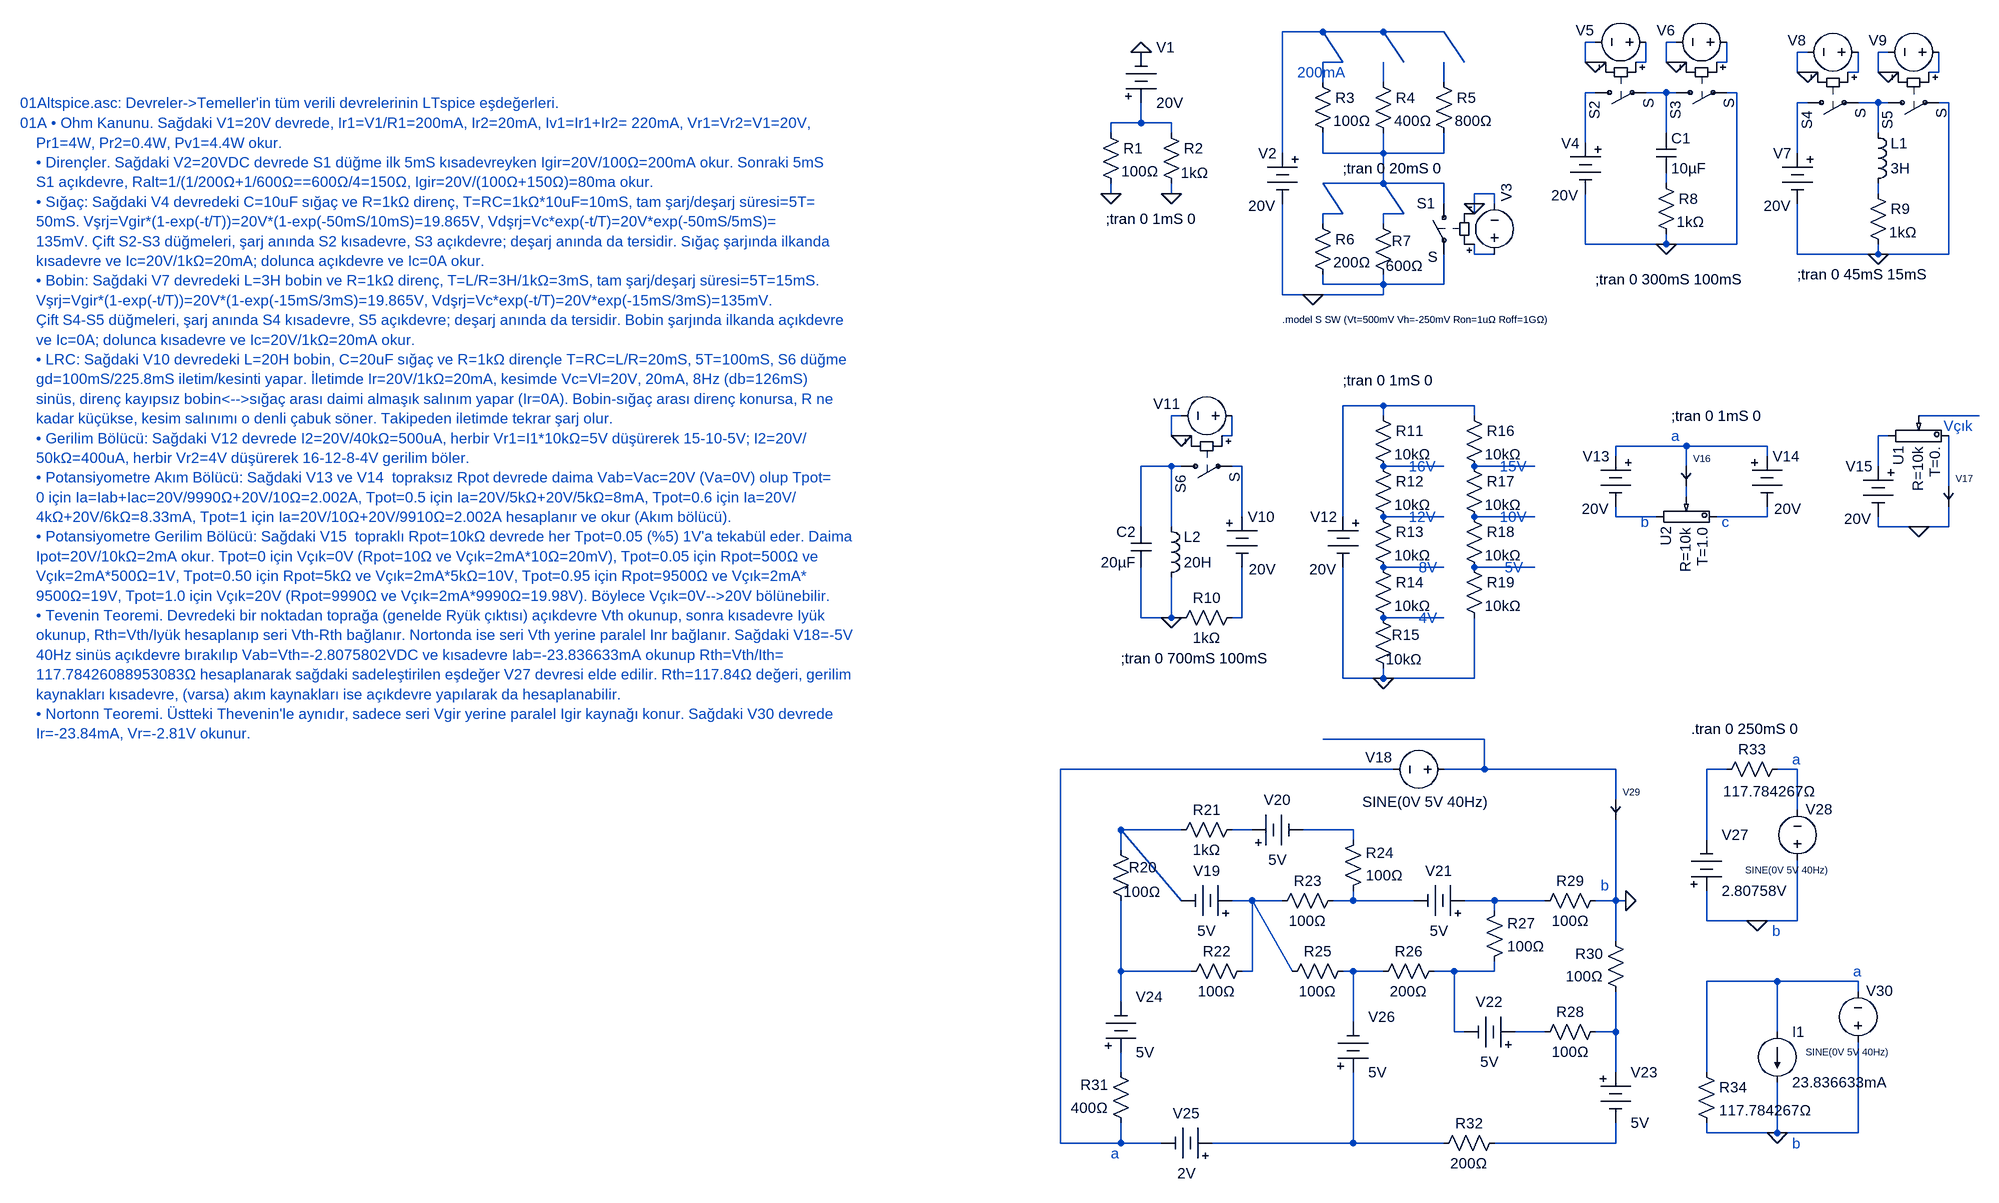
[diagram p0: schematic 01Altspice.asc]
01Altspice.asc, the LTspice schematic file:
Version 4
SHEET 1 2528 1760
WIRE 1280 -64 1216 -64
WIRE 1376 -64 1280 -64
WIRE 1472 -64 1376 -64
WIRE 1712 -48 1696 -48
WIRE 1840 -48 1824 -48
WIRE 2048 -32 2032 -32
WIRE 2176 -32 2160 -32
WIRE 1312 -16 1280 -64
WIRE 1312 -16 1280 -16
WIRE 1408 -16 1376 -64
WIRE 1504 -16 1472 -64
WIRE 1696 -16 1696 -48
WIRE 1712 -16 1696 -16
WIRE 1728 -16 1712 -16
WIRE 1792 -16 1792 -48
WIRE 1792 -16 1776 -16
WIRE 1824 -16 1824 -48
WIRE 1840 -16 1824 -16
WIRE 1856 -16 1840 -16
WIRE 1920 -16 1920 -48
WIRE 1920 -16 1904 -16
WIRE 2032 0 2032 -32
WIRE 2048 0 2032 0
WIRE 2064 0 2048 0
WIRE 2128 0 2128 -32
WIRE 2128 0 2112 0
WIRE 2160 0 2160 -32
WIRE 2176 0 2160 0
WIRE 2192 0 2176 0
WIRE 2256 0 2256 -32
WIRE 2256 0 2240 0
WIRE 1280 16 1280 -16
WIRE 1376 16 1376 -16
WIRE 1472 16 1472 -16
WIRE 1712 32 1696 32
WIRE 1824 32 1792 32
WIRE 1840 32 1824 32
WIRE 1936 32 1920 32
WIRE 2048 48 2032 48
WIRE 2160 48 2128 48
WIRE 2176 48 2160 48
WIRE 2272 48 2256 48
WIRE 992 80 992 48
WIRE 992 80 944 80
WIRE 1040 80 992 80
WIRE 944 96 944 80
WIRE 1040 96 1040 80
WIRE 1824 96 1824 32
WIRE 2160 96 2160 48
WIRE 1696 112 1696 32
WIRE 1216 128 1216 -64
WIRE 1280 128 1280 96
WIRE 1376 128 1376 96
WIRE 1376 128 1280 128
WIRE 1472 128 1472 96
WIRE 1472 128 1376 128
WIRE 2032 128 2032 48
WIRE 1376 176 1376 128
WIRE 1376 176 1280 176
WIRE 1472 176 1376 176
WIRE 1824 176 1824 160
WIRE 944 192 944 176
WIRE 1040 192 1040 176
WIRE 1552 192 1520 192
WIRE 2160 192 2160 176
WIRE 1472 208 1472 176
WIRE 1520 208 1520 192
WIRE 1552 208 1552 192
WIRE 1312 224 1280 176
WIRE 1312 224 1280 224
WIRE 1408 224 1376 176
WIRE 1408 224 1376 224
WIRE 1520 224 1520 208
WIRE 1280 240 1280 224
WIRE 1376 240 1376 224
WIRE 1696 272 1696 192
WIRE 1824 272 1824 256
WIRE 1824 272 1696 272
WIRE 1936 272 1936 32
WIRE 1936 272 1824 272
WIRE 1520 288 1520 272
WIRE 1552 288 1520 288
WIRE 2032 288 2032 208
WIRE 2160 288 2160 272
WIRE 2160 288 2032 288
WIRE 2272 288 2272 48
WIRE 2272 288 2160 288
WIRE 1280 336 1280 320
WIRE 1376 336 1376 320
WIRE 1376 336 1280 336
WIRE 1472 336 1472 288
WIRE 1472 336 1376 336
WIRE 1216 352 1216 208
WIRE 1264 352 1216 352
WIRE 1376 352 1376 336
WIRE 1376 352 1264 352
WIRE 1376 528 1312 528
WIRE 1520 528 1376 528
WIRE 1056 544 1040 544
WIRE 1376 544 1376 528
WIRE 1520 544 1520 528
WIRE 2320 544 2224 544
WIRE 1040 576 1040 544
WIRE 1056 576 1040 576
WIRE 1072 576 1056 576
WIRE 1136 576 1136 544
WIRE 1136 576 1120 576
WIRE 2176 576 2160 576
WIRE 1856 592 1744 592
WIRE 1984 592 1856 592
WIRE 1744 608 1744 592
WIRE 1984 608 1984 592
WIRE 1040 624 992 624
WIRE 1056 624 1040 624
WIRE 1152 624 1136 624
WIRE 1472 624 1376 624
WIRE 1616 624 1520 624
WIRE 1856 624 1856 592
WIRE 2160 624 2160 576
WIRE 2272 656 2272 576
WIRE 1856 672 1856 656
WIRE 1152 704 1152 624
WIRE 1312 704 1312 528
WIRE 1472 704 1376 704
WIRE 1616 704 1520 704
WIRE 1744 704 1744 688
WIRE 1808 704 1744 704
WIRE 1984 704 1984 688
WIRE 1984 704 1904 704
WIRE 992 720 992 624
WIRE 1040 720 1040 624
WIRE 2160 720 2160 704
WIRE 2224 720 2160 720
WIRE 2272 720 2272 688
WIRE 2272 720 2224 720
WIRE 1472 784 1376 784
WIRE 1616 784 1520 784
WIRE 992 864 992 784
WIRE 1040 864 1040 800
WIRE 1040 864 992 864
WIRE 1056 864 1040 864
WIRE 1152 864 1152 784
WIRE 1152 864 1136 864
WIRE 1472 864 1376 864
WIRE 1312 960 1312 784
WIRE 1376 960 1376 944
WIRE 1376 960 1312 960
WIRE 1520 960 1520 864
WIRE 1520 960 1376 960
WIRE 1536 1056 1280 1056
WIRE 1392 1104 864 1104
WIRE 1536 1104 1536 1056
WIRE 1536 1104 1472 1104
WIRE 1744 1104 1536 1104
WIRE 1920 1104 1888 1104
WIRE 2032 1104 2000 1104
WIRE 1744 1152 1744 1104
WIRE 2032 1168 2032 1104
WIRE 1056 1200 960 1200
WIRE 1168 1200 1136 1200
WIRE 1328 1200 1248 1200
WIRE 1328 1216 1328 1200
WIRE 1888 1216 1888 1104
WIRE 960 1232 960 1200
WIRE 1056 1312 960 1200
WIRE 1168 1312 1136 1312
WIRE 1216 1312 1168 1312
WIRE 1328 1312 1328 1296
WIRE 1328 1312 1296 1312
WIRE 1424 1312 1328 1312
WIRE 1552 1312 1504 1312
WIRE 1632 1312 1552 1312
WIRE 1744 1312 1744 1184
WIRE 1744 1312 1712 1312
WIRE 1760 1312 1744 1312
WIRE 1552 1328 1552 1312
WIRE 1888 1344 1888 1296
WIRE 1968 1344 1888 1344
WIRE 2032 1344 2032 1248
WIRE 2032 1344 1968 1344
WIRE 1744 1376 1744 1312
WIRE 960 1424 960 1312
WIRE 1072 1424 960 1424
WIRE 1168 1424 1168 1312
WIRE 1168 1424 1152 1424
WIRE 1232 1424 1168 1312
WIRE 1328 1424 1312 1424
WIRE 1376 1424 1328 1424
WIRE 1488 1424 1456 1424
WIRE 1552 1424 1552 1408
WIRE 1552 1424 1488 1424
WIRE 2000 1440 1888 1440
WIRE 2128 1440 2000 1440
WIRE 2128 1456 2128 1440
WIRE 960 1472 960 1424
WIRE 1328 1504 1328 1424
WIRE 1488 1520 1488 1424
WIRE 1504 1520 1488 1520
WIRE 1632 1520 1584 1520
WIRE 1744 1520 1744 1456
WIRE 1744 1520 1712 1520
WIRE 2000 1520 2000 1440
WIRE 960 1584 960 1552
WIRE 1744 1584 1744 1520
WIRE 1888 1584 1888 1440
WIRE 1888 1680 1888 1664
WIRE 2000 1680 2000 1600
WIRE 2000 1680 1888 1680
WIRE 2128 1680 2128 1536
WIRE 2128 1680 2000 1680
WIRE 864 1696 864 1104
WIRE 960 1696 960 1664
WIRE 960 1696 864 1696
WIRE 1024 1696 960 1696
WIRE 1328 1696 1328 1584
WIRE 1328 1696 1104 1696
WIRE 1472 1696 1328 1696
WIRE 1744 1696 1744 1664
WIRE 1744 1696 1552 1696
FLAG 944 192 0
FLAG 1040 192 0
FLAG 992 -32 0
FLAG 1264 352 0
FLAG 1520 208 0
FLAG 1712 -16 0
FLAG 1824 272 0
FLAG 1840 -16 0
FLAG 2048 0 0
FLAG 2160 288 0
FLAG 2176 0 0
FLAG 1040 864 0
FLAG 1056 576 0
FLAG 1376 960 0
FLAG 2224 720 0
FLAG 1760 1312 0
FLAG 1968 1344 0
FLAG 2000 1680 0
SYMBOL Misc\\battery 992 64 M180
WINDOW 0 24 104 Left 2
WINDOW 3 24 16 Left 2
SYMATTR InstName V1
SYMATTR Value 20V
SYMBOL res 928 80 R0
WINDOW 3 33 77 Left 2
SYMATTR Value 100Ω
SYMATTR InstName R1
SYMBOL res 1024 80 R0
WINDOW 3 31 79 Left 2
SYMATTR Value 1kΩ
SYMATTR InstName R2
SYMBOL Misc\\battery 1216 112 M0
WINDOW 0 9 16 Left 2
WINDOW 3 11 99 Left 2
SYMATTR InstName V2
SYMATTR Value 20V
SYMBOL res 1264 0 R0
WINDOW 3 33 77 Left 2
SYMATTR Value 100Ω
SYMATTR InstName R3
SYMBOL res 1360 0 R0
WINDOW 3 33 77 Left 2
SYMATTR Value 400Ω
SYMATTR InstName R4
SYMBOL res 1456 0 R0
WINDOW 3 33 77 Left 2
SYMATTR Value 800Ω
SYMATTR InstName R5
SYMBOL res 1264 224 R0
WINDOW 3 33 77 Left 2
SYMATTR Value 200Ω
SYMATTR InstName R6
SYMBOL res 1360 224 R0
WINDOW 3 20 82 Left 2
WINDOW 0 29 43 Left 2
SYMATTR Value 600Ω
SYMATTR InstName R7
SYMBOL sw 1472 192 M0
WINDOW 0 14 15 Left 2
WINDOW 3 10 100 Left 2
SYMATTR InstName S1
SYMATTR Value S
SYMBOL voltage 1552 304 M180
WINDOW 0 19 98 VRight 2
WINDOW 3 67 -33 Invisible 2
WINDOW 123 0 0 Left 0
WINDOW 39 0 0 Left 0
SYMATTR InstName V3
SYMATTR Value PULSE(0V 1V 0S 1nS 1nS 5mS 10mS)
SYMBOL Misc\\battery 1696 96 M0
WINDOW 0 9 16 Left 2
WINDOW 3 11 99 Left 2
SYMATTR InstName V4
SYMATTR Value 20V
SYMBOL cap 1808 96 R0
SYMATTR InstName C1
SYMATTR Value 10µF
SYMBOL res 1808 160 R0
WINDOW 3 33 77 Left 2
SYMATTR Value 1kΩ
SYMATTR InstName R8
SYMBOL sw 1696 32 M90
WINDOW 0 14 15 Left 2
WINDOW 3 10 100 Left 2
SYMATTR InstName S2
SYMATTR Value S
SYMBOL voltage 1808 -48 M270
WINDOW 0 19 98 VRight 2
WINDOW 3 67 -33 Invisible 2
WINDOW 123 0 0 Left 0
WINDOW 39 0 0 Left 0
SYMATTR InstName V5
SYMATTR Value PULSE(0V 1V 0S 1nS 1nS 50mS 100mS)
SYMBOL sw 1824 32 M90
WINDOW 0 14 15 Left 2
WINDOW 3 10 100 Left 2
SYMATTR InstName S3
SYMATTR Value S
SYMBOL voltage 1936 -48 M270
WINDOW 0 19 98 VRight 2
WINDOW 3 67 -33 Invisible 2
WINDOW 123 0 0 Left 0
WINDOW 39 0 0 Left 0
SYMATTR InstName V6
SYMATTR Value PULSE(0V 1V 50mS 1nS 1nS 50mS 100mS)
SYMBOL Misc\\battery 2032 112 M0
WINDOW 0 9 16 Left 2
WINDOW 3 11 99 Left 2
SYMATTR InstName V7
SYMATTR Value 20V
SYMBOL res 2144 176 R0
WINDOW 3 33 77 Left 2
SYMATTR Value 1kΩ
SYMATTR InstName R9
SYMBOL sw 2032 48 M90
WINDOW 0 14 15 Left 2
WINDOW 3 10 100 Left 2
SYMATTR InstName S4
SYMATTR Value S
SYMBOL voltage 2144 -32 M270
WINDOW 0 19 98 VRight 2
WINDOW 3 67 -33 Invisible 2
WINDOW 123 0 0 Left 0
WINDOW 39 0 0 Left 0
SYMATTR InstName V8
SYMATTR Value PULSE(0V 1V 0S 1nS 1nS 15mS 30mS)
SYMBOL sw 2160 48 M90
WINDOW 0 14 15 Left 2
WINDOW 3 10 100 Left 2
SYMATTR InstName S5
SYMATTR Value S
SYMBOL voltage 2272 -32 M270
WINDOW 0 19 98 VRight 2
WINDOW 3 67 -33 Invisible 2
WINDOW 123 0 0 Left 0
WINDOW 39 0 0 Left 0
SYMATTR InstName V9
SYMATTR Value PULSE(0V 1V 15mS 1nS 1nS 15mS 30mS)
SYMBOL ind 2144 192 M180
WINDOW 0 36 80 Left 2
WINDOW 3 36 40 Left 2
SYMATTR InstName L1
SYMATTR Value 3H
SYMBOL Misc\\battery 1152 688 R0
WINDOW 0 9 16 Left 2
WINDOW 3 11 99 Left 2
SYMATTR InstName V10
SYMATTR Value 20V
SYMBOL res 1152 848 R90
WINDOW 3 32 56 VTop 2
WINDOW 0 0 56 VBottom 2
SYMATTR Value 1kΩ
SYMATTR InstName R10
SYMBOL sw 1040 624 M90
WINDOW 0 14 15 Left 2
WINDOW 3 10 100 Left 2
SYMATTR InstName S6
SYMATTR Value S
SYMBOL voltage 1152 544 M270
WINDOW 0 19 98 VRight 2
WINDOW 3 67 -33 Invisible 2
WINDOW 123 0 0 Left 0
WINDOW 39 0 0 Left 0
SYMATTR InstName V11
SYMATTR Value PULSE(0V 1V 0mS 1nS 1nS 100mS 225.8mS)
SYMBOL ind 1024 816 M180
WINDOW 0 36 80 Left 2
WINDOW 3 36 40 Left 2
SYMATTR InstName L2
SYMATTR Value 20H
SYMBOL cap 1008 720 M0
SYMATTR InstName C2
SYMATTR Value 20µF
SYMBOL Misc\\battery 1312 688 M0
WINDOW 0 9 16 Left 2
WINDOW 3 11 99 Left 2
SYMATTR InstName V12
SYMATTR Value 20V
SYMBOL res 1360 528 R0
WINDOW 3 33 77 Left 2
SYMATTR Value 10kΩ
SYMATTR InstName R11
SYMBOL res 1360 608 R0
WINDOW 3 33 77 Left 2
SYMATTR Value 10kΩ
SYMATTR InstName R12
SYMBOL res 1360 688 R0
WINDOW 3 33 77 Left 2
SYMATTR Value 10kΩ
SYMATTR InstName R13
SYMBOL res 1360 768 R0
WINDOW 3 33 77 Left 2
SYMATTR Value 10kΩ
SYMATTR InstName R14
SYMBOL res 1360 848 R0
WINDOW 3 20 82 Left 2
WINDOW 0 29 43 Left 2
SYMATTR Value 10kΩ
SYMATTR InstName R15
SYMBOL res 1504 528 R0
WINDOW 3 33 77 Left 2
SYMATTR Value 10kΩ
SYMATTR InstName R16
SYMBOL res 1504 608 R0
WINDOW 3 33 77 Left 2
SYMATTR Value 10kΩ
SYMATTR InstName R17
SYMBOL res 1504 688 R0
WINDOW 3 33 77 Left 2
SYMATTR Value 10kΩ
SYMATTR InstName R18
SYMBOL res 1504 768 R0
WINDOW 3 33 77 Left 2
SYMATTR Value 10kΩ
SYMATTR InstName R19
SYMBOL Misc\\battery 2160 608 M0
WINDOW 0 9 16 Left 2
WINDOW 3 11 99 Left 2
SYMATTR InstName V15
SYMATTR Value 20V
SYMBOL pot 2224 576 M90
SYMATTR InstName U1
SYMATTR Value2 T=0.
SYMBOL Misc\\battery 1744 592 M0
WINDOW 0 9 16 Left 2
WINDOW 3 11 99 Left 2
SYMATTR InstName V13
SYMATTR Value 20V
SYMBOL Misc\\battery 1984 592 R0
WINDOW 0 9 16 Left 2
WINDOW 3 11 99 Left 2
SYMATTR InstName V14
SYMATTR Value 20V
SYMBOL pot 1856 704 M90
SYMATTR InstName U2
SYMATTR Value2 T=1.0
SYMBOL Ammeter 1856 608 R0
SYMATTR InstName V16
SYMBOL Ammeter 2272 640 R0
SYMATTR InstName V17
SYMBOL res 944 1216 R0
WINDOW 3 20 82 Left 2
WINDOW 0 29 43 Left 2
SYMATTR Value 100Ω
SYMATTR InstName R20
SYMBOL res 1152 1184 R90
WINDOW 3 32 56 VTop 2
WINDOW 0 0 56 VBottom 2
SYMATTR Value 1kΩ
SYMATTR InstName R21
SYMBOL Misc\\battery 1152 1312 M270
WINDOW 0 32 56 VTop 2
WINDOW 3 -32 56 VBottom 2
SYMATTR InstName V19
SYMATTR Value 5V
SYMBOL res 1168 1408 R90
WINDOW 3 32 56 VTop 2
WINDOW 0 0 56 VBottom 2
SYMATTR Value 100Ω
SYMATTR InstName R22
SYMBOL Misc\\battery 1152 1200 R270
WINDOW 0 32 56 VTop 2
WINDOW 3 -32 56 VBottom 2
SYMATTR InstName V20
SYMATTR Value 5V
SYMBOL res 1312 1296 R90
WINDOW 3 32 56 VTop 2
WINDOW 0 0 56 VBottom 2
SYMATTR Value 100Ω
SYMATTR InstName R23
SYMBOL res 1312 1312 M180
WINDOW 3 36 40 Left 2
WINDOW 0 36 76 Left 2
SYMATTR Value 100Ω
SYMATTR InstName R24
SYMBOL Misc\\battery 1520 1312 M270
WINDOW 0 32 56 VTop 2
WINDOW 3 -32 56 VBottom 2
SYMATTR InstName V21
SYMATTR Value 5V
SYMBOL res 1328 1408 R90
WINDOW 3 32 56 VTop 2
WINDOW 0 0 56 VBottom 2
SYMATTR Value 100Ω
SYMATTR InstName R25
SYMBOL res 1472 1408 R90
WINDOW 3 32 56 VTop 2
WINDOW 0 0 56 VBottom 2
SYMATTR Value 200Ω
SYMATTR InstName R26
SYMBOL res 1536 1424 M180
WINDOW 3 36 40 Left 2
WINDOW 0 36 76 Left 2
SYMATTR Value 100Ω
SYMATTR InstName R27
SYMBOL Misc\\battery 1600 1520 M270
WINDOW 0 32 56 VTop 2
WINDOW 3 -32 56 VBottom 2
SYMATTR InstName V22
SYMATTR Value 5V
SYMBOL res 1728 1504 R90
WINDOW 3 32 56 VTop 2
WINDOW 0 0 56 VBottom 2
SYMATTR Value 100Ω
SYMATTR InstName R28
SYMBOL res 1728 1296 R90
WINDOW 3 32 56 VTop 2
WINDOW 0 0 56 VBottom 2
SYMATTR Value 100Ω
SYMATTR InstName R29
SYMBOL res 1760 1472 R180
WINDOW 3 36 40 Left 2
WINDOW 0 36 76 Left 2
SYMATTR Value 100Ω
SYMATTR InstName R30
SYMBOL Misc\\battery 1744 1568 R0
SYMATTR InstName V23
SYMATTR Value 5V
SYMBOL Misc\\battery 960 1568 M180
WINDOW 0 24 104 Left 2
WINDOW 3 24 16 Left 2
SYMATTR InstName V24
SYMATTR Value 5V
SYMBOL res 976 1680 R180
WINDOW 3 36 40 Left 2
WINDOW 0 36 76 Left 2
SYMATTR Value 400Ω
SYMATTR InstName R31
SYMBOL Misc\\battery 1120 1696 M270
WINDOW 0 32 56 VTop 2
WINDOW 3 -32 56 VBottom 2
SYMATTR InstName V25
SYMATTR Value 2V
SYMBOL Misc\\battery 1328 1600 M180
WINDOW 0 24 104 Left 2
WINDOW 3 24 16 Left 2
SYMATTR InstName V26
SYMATTR Value 5V
SYMBOL res 1568 1680 R90
WINDOW 3 32 56 VTop 2
WINDOW 0 0 56 VBottom 2
SYMATTR Value 200Ω
SYMATTR InstName R32
SYMBOL Misc\\battery 1888 1312 M180
WINDOW 0 24 104 Left 2
WINDOW 3 24 16 Left 2
SYMATTR InstName V27
SYMATTR Value 2.80758V
SYMBOL res 1904 1120 R270
WINDOW 3 -3 84 VBottom 2
WINDOW 0 32 56 VTop 2
SYMATTR Value 117.784267Ω
SYMATTR InstName R33
SYMBOL voltage 1488 1104 M270
WINDOW 0 19 98 VRight 2
WINDOW 3 -51 -55 VRight 2
WINDOW 123 0 0 Left 0
WINDOW 39 0 0 Left 0
SYMATTR InstName V18
SYMATTR Value SINE(0V 5V 40Hz)
SYMBOL voltage 2032 1264 M180
WINDOW 0 13 97 Left 2
WINDOW 3 -83 0 Left 1
WINDOW 123 0 0 Left 0
WINDOW 39 0 0 Left 0
SYMATTR InstName V28
SYMATTR Value SINE(0V 5V 40Hz)
SYMBOL Ammeter 1744 1136 R0
SYMATTR InstName V29
SYMBOL res 1872 1568 R0
SYMATTR Value 117.784267Ω
SYMATTR InstName R34
SYMBOL voltage 2128 1552 M180
WINDOW 0 13 97 Left 2
WINDOW 3 -83 0 Left 1
WINDOW 123 0 0 Left 0
WINDOW 39 0 0 Left 0
SYMATTR InstName V30
SYMATTR Value SINE(0V 5V 40Hz)
SYMBOL current 2000 1520 R0
SYMATTR InstName I1
SYMATTR Value 23.836633mA
TEXT 936 232 Left 2 !;tran 0 1mS 0
TEXT -784 48 Left 2 ;01Altspice.asc: Devreler->Temeller'in tüm verili devrelerinin LTspice eşdeğerleri.
TEXT -784 80 Left 2 ;01A • Ohm Kanunu. Sağdaki V1=20V devrede, Ir1=V1/R1=200mA, Ir2=20mA, Iv1=Ir1+Ir2= 220mA, Vr1=Vr2=V1=20V, \n    Pr1=4W, Pr2=0.4W, Pv1=4.4W okur.\n    • Dirençler. Sağdaki V2=20VDC devrede S1 düğme ilk 5mS kısadevreyken Igir=20V/100Ω=200mA okur. Sonraki 5mS\n    S1 açıkdevre, Ralt=1/(1/200Ω+1/600Ω==600Ω/4=150Ω, Igir=20V/(100Ω+150Ω)=80ma okur.\n    • Sığaç: Sağdaki V4 devredeki C=10uF sığaç ve R=1kΩ direnç, T=RC=1kΩ*10uF=10mS, tam şarj/deşarj süresi=5T=\n    50mS. Vşrj=Vgir*(1-exp(-t/T))=20V*(1-exp(-50mS/10mS)=19.865V, Vdşrj=Vc*exp(-t/T)=20V*exp(-50mS/5mS)=\n    135mV. Çift S2-S3 düğmeleri, şarj anında S2 kısadevre, S3 açıkdevre; deşarj anında da tersidir. Sığaç şarjında ilkanda\n    kısadevre ve Ic=20V/1kΩ=20mA; dolunca açıkdevre ve Ic=0A okur.\n    • Bobin: Sağdaki V7 devredeki L=3H bobin ve R=1kΩ direnç, T=L/R=3H/1kΩ=3mS, tam şarj/deşarj süresi=5T=15mS. \n    Vşrj=Vgir*(1-exp(-t/T))=20V*(1-exp(-15mS/3mS)=19.865V, Vdşrj=Vc*exp(-t/T)=20V*exp(-15mS/3mS)=135mV. \n    Çift S4-S5 düğmeleri, şarj anında S4 kısadevre, S5 açıkdevre; deşarj anında da tersidir. Bobin şarjında ilkanda açıkdevre \n    ve Ic=0A; dolunca kısadevre ve Ic=20V/1kΩ=20mA okur.\n    • LRC: Sağdaki V10 devredeki L=20H bobin, C=20uF sığaç ve R=1kΩ dirençle T=RC=L/R=20mS, 5T=100mS, S6 düğme\n    gd=100mS/225.8mS iletim/kesinti yapar. İletimde Ir=20V/1kΩ=20mA, kesimde Vc=Vl=20V, 20mA, 8Hz (db=126mS) \n    sinüs, direnç kayıpsız bobin<-->sığaç arası daimi almaşık salınım yapar (Ir=0A). Bobin-sığaç arası direnç konursa, R ne \n    kadar küçükse, kesim salınımı o denli çabuk söner. Takipeden iletimde tekrar şarj olur.\n    • Gerilim Bölücü: Sağdaki V12 devrede I2=20V/40kΩ=500uA, herbir Vr1=I1*10kΩ=5V düşürerek 15-10-5V; I2=20V/\n    50kΩ=400uA, herbir Vr2=4V düşürerek 16-12-8-4V gerilim böler.\n    • Potansiyometre Akım Bölücü: Sağdaki V13 ve V14  topraksız Rpot devrede daima Vab=Vac=20V (Va=0V) olup Tpot=\n    0 için Ia=Iab+Iac=20V/9990Ω+20V/10Ω=2.002A, Tpot=0.5 için Ia=20V/5kΩ+20V/5kΩ=8mA, Tpot=0.6 için Ia=20V/\n    4kΩ+20V/6kΩ=8.33mA, Tpot=1 için Ia=20V/10Ω+20V/9910Ω=2.002A hesaplanır ve okur (Akım bölücü).\n    • Potansiyometre Gerilim Bölücü: Sağdaki V15  topraklı Rpot=10kΩ devrede her Tpot=0.05 (%5) 1V'a tekabül eder. Daima\n    Ipot=20V/10kΩ=2mA okur. Tpot=0 için Vçık=0V (Rpot=10Ω ve Vçık=2mA*10Ω=20mV), Tpot=0.05 için Rpot=500Ω ve\n    Vçık=2mA*500Ω=1V, Tpot=0.50 için Rpot=5kΩ ve Vçık=2mA*5kΩ=10V, Tpot=0.95 için Rpot=9500Ω ve Vçık=2mA*\n    9500Ω=19V, Tpot=1.0 için Vçık=20V (Rpot=9990Ω ve Vçık=2mA*9990Ω=19.98V). Böylece Vçık=0V-->20V bölünebilir.\n    • Tevenin Teoremi. Devredeki bir noktadan toprağa (genelde Ryük çıktısı) açıkdevre Vth okunup, sonra kısadevre Iyük\n    okunup, Rth=Vth/Iyük hesaplanıp seri Vth-Rth bağlanır. Nortonda ise seri Vth yerine paralel Inr bağlanır. Sağdaki V18=-5V\n    40Hz sinüs açıkdevre bırakılıp Vab=Vth=-2.8075802VDC ve kısadevre Iab=-23.836633mA okunup Rth=Vth/Ith=\n    117.78426088953083Ω hesaplanarak sağdaki sadeleştirilen eşdeğer V27 devresi elde edilir. Rth=117.84Ω değeri, gerilim\n    kaynakları kısadevre, (varsa) akım kaynakları ise açıkdevre yapılarak da hesaplanabilir.\n    • Nortonn Teoremi. Üstteki Thevenin'le aynıdır, sadece seri Vgir yerine paralel Igir kaynağı konur. Sağdaki V30 devrede\n    Ir=-23.84mA, Vr=-2.81V okunur.
TEXT 1240 0 Left 2 ;200mA
TEXT 1216 392 Left 1 !.model S SW (Vt=500mV Vh=-250mV Ron=1uΩ Roff=1GΩ)
TEXT 1312 152 Left 2 !;tran 0 20mS 0
TEXT 1712 328 Left 2 !;tran 0 300mS 100mS
TEXT 2032 320 Left 2 !;tran 0 45mS 15mS
TEXT 960 928 Left 2 !;tran 0 700mS 100mS
TEXT 1312 488 Left 2 !;tran 0 1mS 0
TEXT 1560 624 Left 2 ;15V
TEXT 1560 704 Left 2 ;10V
TEXT 1568 784 Left 2 ;5V
TEXT 1432 864 Left 2 ;4V
TEXT 1432 784 Left 2 ;8V
TEXT 1416 704 Left 2 ;12V
TEXT 1416 624 Left 2 ;16V
TEXT 1832 544 Left 2 !;tran 0 1mS 0
TEXT 2264 560 Left 2 ;Vçık
TEXT 1832 576 Left 2 ;a
TEXT 1784 712 Left 2 ;b
TEXT 1912 712 Left 2 ;c
TEXT 1864 1040 Left 2 !.tran 0 250mS 0
TEXT 944 1712 Left 2 ;a
TEXT 1720 1288 Left 2 ;b
TEXT 2024 1088 Left 2 ;a
TEXT 1992 1360 Left 2 ;b
TEXT 2120 1424 Left 2 ;a
TEXT 2024 1696 Left 2 ;b

The netlist it stands for:
* 01Altspice.asc
V1 N012 0 20V
R1 N012 0 100Ω
R2 N012 0 1kΩ
V2 N001 0 20V
R3 N001 N013 100Ω
R4 N006 N013 400Ω
R5 N007 N013 800Ω
R6 N013 0 200Ω
R7 N013 0 600Ω
S1 N013 0 N016 0 S
V3 N016 0 PULSE(0V 1V 0S 1nS 1nS 5mS 10mS)
V4 N008 0 20V
C1 N009 N014 10µF
R8 N014 0 1kΩ
S2 N008 N009 N002 0 S
V5 N002 0 PULSE(0V 1V 0S 1nS 1nS 50mS 100mS)
S3 N009 0 N003 0 S
V6 N003 0 PULSE(0V 1V 50mS 1nS 1nS 50mS 100mS)
V7 N010 0 20V
R9 N015 0 1kΩ
S4 N010 N011 N004 0 S
V8 N004 0 PULSE(0V 1V 0S 1nS 1nS 15mS 30mS)
S5 N011 0 N005 0 S
V9 N005 0 PULSE(0V 1V 15mS 1nS 1nS 15mS 30mS)
L1 N015 N011 3H
V10 N023 N034 20V
R10 N034 0 1kΩ
S6 N022 N023 N019 0 S
V11 N019 0 PULSE(0V 1V 0mS 1nS 1nS 100mS 225.8mS)
L2 0 N022 20H
C2 N022 0 20µF
V12 N017 0 20V
R11 N017 N024 10kΩ
R12 N024 N028 10kΩ
R13 N028 N032 10kΩ
R14 N032 N035 10kΩ
R15 N035 0 10kΩ
R16 N017 N025 10kΩ
R17 N025 N029 10kΩ
R18 N029 N033 10kΩ
R19 N033 0 10kΩ
V15 N020 0 20V
XU1 N020 N026 N018 pot R=10k T=0.  ; pins A B C
V13 N021 N030 20V
V14 N021 N031 20V
XU2 N030 N031 N027 pot R=10k T=1.0  ; pins A B C
V16 N021 N027 0
V17 N026 0 0
R20 N040 N046 100Ω
R21 N041 N040 1kΩ
V19 N043 N040 5V
R22 N043 N046 100Ω
V20 N041 N042 5V
R23 N044 N043 100Ω
R24 N044 N042 100Ω
V21 N045 N044 5V
R25 N047 N043 100Ω
R26 N048 N047 200Ω
R27 N048 N045 100Ω
V22 N050 N048 5V
R28 N051 N050 100Ω
R29 0 N045 100Ω
R30 N051 0 100Ω
V23 N051 N054 5V
V24 N052 N046 5V
R31 N037 N052 400Ω
V25 N053 N037 2V
V26 N053 N047 5V
R32 N054 N053 200Ω
V27 0 N038 2.80758V
R33 N038 N039 117.784267Ω
V18 N036 N037 SINE(0V 5V 40Hz)
V28 0 N039 SINE(0V 5V 40Hz)
V29 N036 0 0
R34 N049 0 117.784267Ω
V30 0 N049 SINE(0V 5V 40Hz)
I1 N049 0 23.836633mA
;tran 0 1mS 0
* 01Altspice.asc: Devreler->Temeller'in tüm verili devrelerinin LTspice eşdeğerleri.
* 01A • Ohm Kanunu. Sağdaki V1=20V devrede, Ir1=V1/R1=200mA, Ir2=20mA, Iv1=Ir1+Ir2= 220mA, Vr1=Vr2=V1=20V,
*     Pr1=4W, Pr2=0.4W, Pv1=4.4W okur.
*     • Dirençler. Sağdaki V2=20VDC devrede S1 düğme ilk 5mS kısadevreyken Igir=20V/100Ω=200mA okur. Sonraki 5mS
*     S1 açıkdevre, Ralt=1/(1/200Ω+1/600Ω==600Ω/4=150Ω, Igir=20V/(100Ω+150Ω)=80ma okur.
*     • Sığaç: Sağdaki V4 devredeki C=10uF sığaç ve R=1kΩ direnç, T=RC=1kΩ*10uF=10mS, tam şarj/deşarj süresi=5T=
*     50mS. Vşrj=Vgir*(1-exp(-t/T))=20V*(1-exp(-50mS/10mS)=19.865V, Vdşrj=Vc*exp(-t/T)=20V*exp(-50mS/5mS)=
*     135mV. Çift S2-S3 düğmeleri, şarj anında S2 kısadevre, S3 açıkdevre; deşarj anında da tersidir. Sığaç şarjında ilkanda
*     kısadevre ve Ic=20V/1kΩ=20mA; dolunca açıkdevre ve Ic=0A okur.
*     • Bobin: Sağdaki V7 devredeki L=3H bobin ve R=1kΩ direnç, T=L/R=3H/1kΩ=3mS, tam şarj/deşarj süresi=5T=15mS.
*     Vşrj=Vgir*(1-exp(-t/T))=20V*(1-exp(-15mS/3mS)=19.865V, Vdşrj=Vc*exp(-t/T)=20V*exp(-15mS/3mS)=135mV.
*     Çift S4-S5 düğmeleri, şarj anında S4 kısadevre, S5 açıkdevre; deşarj anında da tersidir. Bobin şarjında ilkanda açıkdevre
*     ve Ic=0A; dolunca kısadevre ve Ic=20V/1kΩ=20mA okur.
*     • LRC: Sağdaki V10 devredeki L=20H bobin, C=20uF sığaç ve R=1kΩ dirençle T=RC=L/R=20mS, 5T=100mS, S6 düğme
*     gd=100mS/225.8mS iletim/kesinti yapar. İletimde Ir=20V/1kΩ=20mA, kesimde Vc=Vl=20V, 20mA, 8Hz (db=126mS)
*     sinüs, direnç kayıpsız bobin<-->sığaç arası daimi almaşık salınım yapar (Ir=0A). Bobin-sığaç arası direnç konursa, R ne
*     kadar küçükse, kesim salınımı o denli çabuk söner. Takipeden iletimde tekrar şarj olur.
*     • Gerilim Bölücü: Sağdaki V12 devrede I2=20V/40kΩ=500uA, herbir Vr1=I1*10kΩ=5V düşürerek 15-10-5V; I2=20V/
*     50kΩ=400uA, herbir Vr2=4V düşürerek 16-12-8-4V gerilim böler.
*     • Potansiyometre Akım Bölücü: Sağdaki V13 ve V14  topraksız Rpot devrede daima Vab=Vac=20V (Va=0V) olup Tpot=
*     0 için Ia=Iab+Iac=20V/9990Ω+20V/10Ω=2.002A, Tpot=0.5 için Ia=20V/5kΩ+20V/5kΩ=8mA, Tpot=0.6 için Ia=20V/
*     4kΩ+20V/6kΩ=8.33mA, Tpot=1 için Ia=20V/10Ω+20V/9910Ω=2.002A hesaplanır ve okur (Akım bölücü).
*     • Potansiyometre Gerilim Bölücü: Sağdaki V15  topraklı Rpot=10kΩ devrede her Tpot=0.05 (%5) 1V'a tekabül eder. Daima
*     Ipot=20V/10kΩ=2mA okur. Tpot=0 için Vçık=0V (Rpot=10Ω ve Vçık=2mA*10Ω=20mV), Tpot=0.05 için Rpot=500Ω ve
*     Vçık=2mA*500Ω=1V, Tpot=0.50 için Rpot=5kΩ ve Vçık=2mA*5kΩ=10V, Tpot=0.95 için Rpot=9500Ω ve Vçık=2mA*
*     9500Ω=19V, Tpot=1.0 için Vçık=20V (Rpot=9990Ω ve Vçık=2mA*9990Ω=19.98V). Böylece Vçık=0V-->20V bölünebilir.
*     • Tevenin Teoremi. Devredeki bir noktadan toprağa (genelde Ryük çıktısı) açıkdevre Vth okunup, sonra kısadevre Iyük
*     okunup, Rth=Vth/Iyük hesaplanıp seri Vth-Rth bağlanır. Nortonda ise seri Vth yerine paralel Inr bağlanır. Sağdaki V18=-5V
*     40Hz sinüs açıkdevre bırakılıp Vab=Vth=-2.8075802VDC ve kısadevre Iab=-23.836633mA okunup Rth=Vth/Ith=
*     117.78426088953083Ω hesaplanarak sağdaki sadeleştirilen eşdeğer V27 devresi elde edilir. Rth=117.84Ω değeri, gerilim
*     kaynakları kısadevre, (varsa) akım kaynakları ise açıkdevre yapılarak da hesaplanabilir.
*     • Nortonn Teoremi. Üstteki Thevenin'le aynıdır, sadece seri Vgir yerine paralel Igir kaynağı konur. Sağdaki V30 devrede
*     Ir=-23.84mA, Vr=-2.81V okunur.
* 200mA
.model S SW (Vt=500mV Vh=-250mV Ron=1uΩ Roff=1GΩ)
;tran 0 20mS 0
;tran 0 300mS 100mS
;tran 0 45mS 15mS
;tran 0 700mS 100mS
;tran 0 1mS 0
* 15V
* 10V
* 5V
* 4V
* 8V
* 12V
* 16V
;tran 0 1mS 0
* Vçık
* a
* b
* c
.tran 0 250mS 0
* a
* b
* a
* b
* a
* b
.lib pot.lib
.backanno
.end